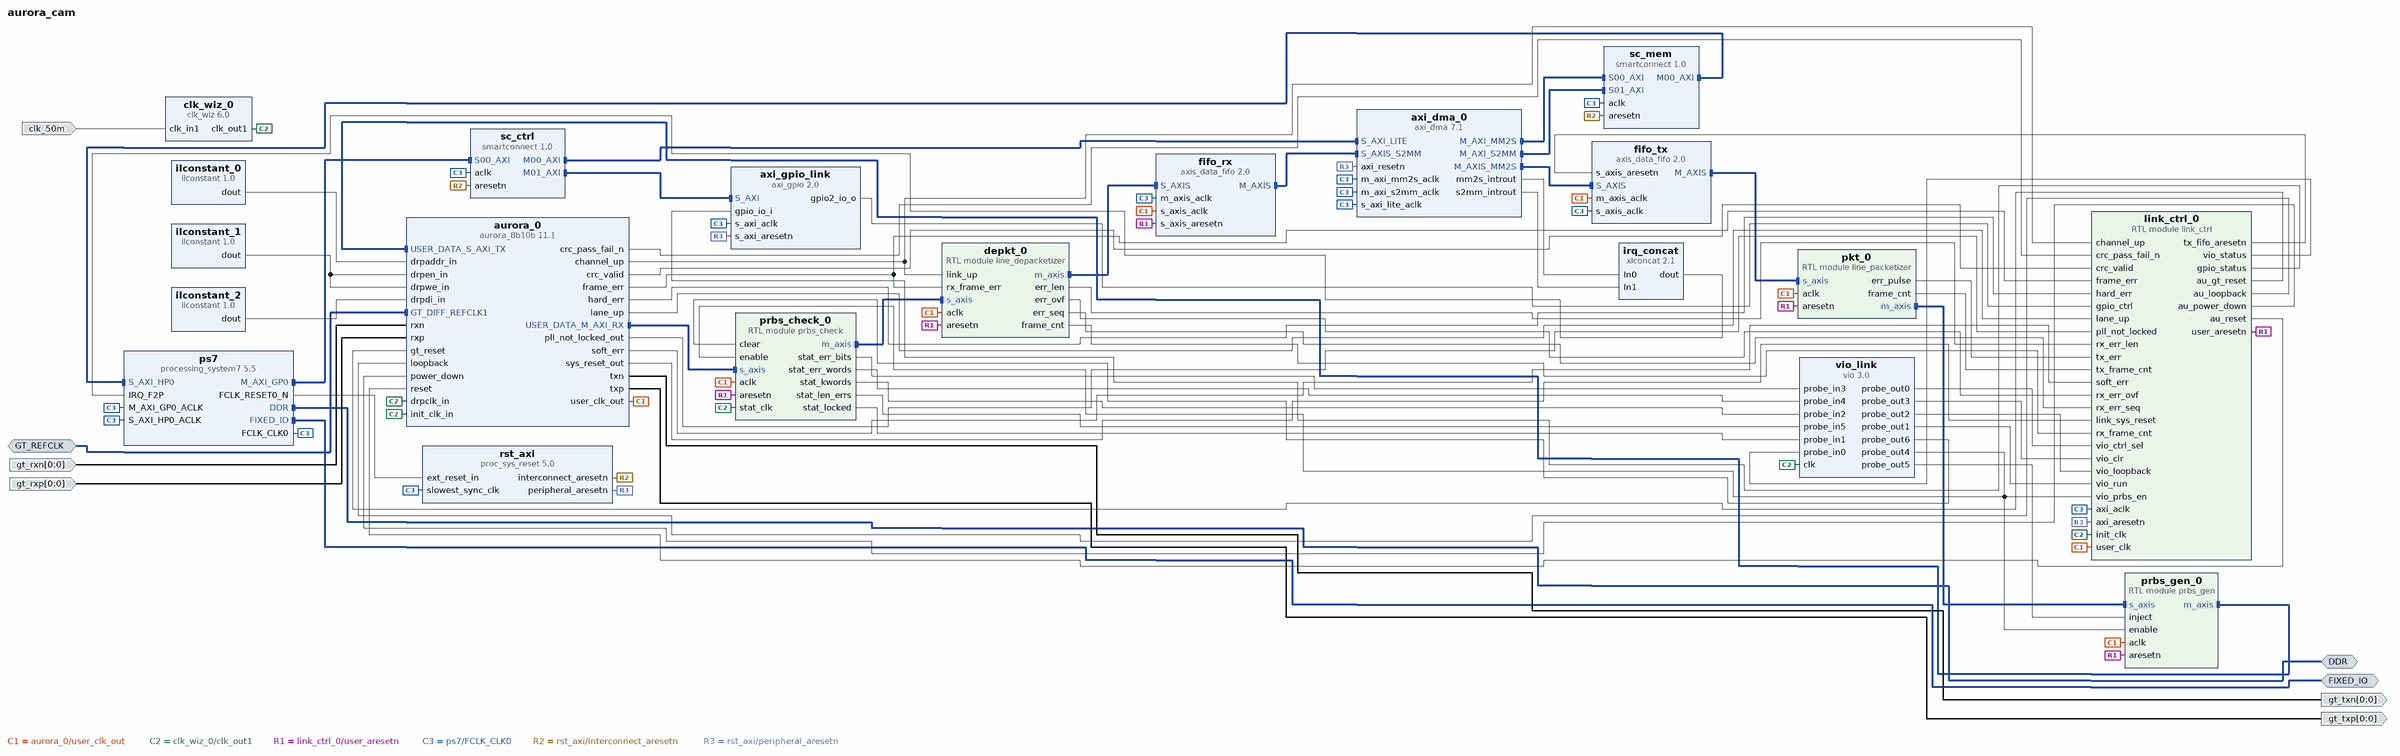
[diagram p0: block diagram of the top level]
# Vivado block design aurora_cam, xc7z015clg485-2, Vivado 2025.2
create_bd_design aurora_cam

create_bd_intf_port -mode Master -vlnv xilinx.com:interface:ddrx_rtl:1.0 DDR
create_bd_intf_port -mode Master -vlnv xilinx.com:display_processing_system7:fixedio_rtl:1.0 FIXED_IO
create_bd_intf_port -mode Slave -vlnv xilinx.com:interface:diff_clock_rtl:1.0 GT_REFCLK
set_property -dict {CONFIG.FREQ_HZ 125000000} [get_bd_intf_ports GT_REFCLK]
create_bd_port -dir O -from 0 -to 0 gt_txp
create_bd_port -dir O -from 0 -to 0 gt_txn
create_bd_port -dir I -from 0 -to 0 gt_rxp
create_bd_port -dir I -from 0 -to 0 gt_rxn
create_bd_port -dir I -type clk clk_50m
set_property -dict {CONFIG.FREQ_HZ 50000000} [get_bd_ports clk_50m]

create_bd_cell -type ip -vlnv xilinx.com:ip:processing_system7:5.5 ps7
set_property -dict [list \
  CONFIG.PCW_APU_PERIPHERAL_FREQMHZ 766.666666 \
  CONFIG.PCW_CPU_CPU_6X4X_MAX_RANGE 767 \
  CONFIG.PCW_ENET0_ENET0_IO {MIO 16 .. 27} \
  CONFIG.PCW_ENET0_GRP_MDIO_ENABLE 1 \
  CONFIG.PCW_ENET0_GRP_MDIO_IO {MIO 52 .. 53} \
  CONFIG.PCW_ENET0_PERIPHERAL_ENABLE 1 \
  CONFIG.PCW_ENET0_RESET_ENABLE 1 \
  CONFIG.PCW_ENET0_RESET_IO {MIO 7} \
  CONFIG.PCW_ENET_RESET_ENABLE 1 \
  CONFIG.PCW_ENET_RESET_SELECT {Share reset pin} \
  CONFIG.PCW_FPGA0_PERIPHERAL_FREQMHZ 100 \
  CONFIG.PCW_GPIO_MIO_GPIO_ENABLE 1 \
  CONFIG.PCW_GPIO_MIO_GPIO_IO MIO \
  CONFIG.PCW_I2C_RESET_ENABLE 0 \
  CONFIG.PCW_IRQ_F2P_INTR 1 \
  CONFIG.PCW_PERIPHERAL_BOARD_PRESET None \
  CONFIG.PCW_PRESET_BANK1_VOLTAGE {LVCMOS 1.8V} \
  CONFIG.PCW_QSPI_GRP_SINGLE_SS_ENABLE 1 \
  CONFIG.PCW_QSPI_GRP_SINGLE_SS_IO {MIO 1 .. 6} \
  CONFIG.PCW_QSPI_PERIPHERAL_ENABLE 1 \
  CONFIG.PCW_QSPI_QSPI_IO {MIO 1 .. 6} \
  CONFIG.PCW_SD0_GRP_CD_ENABLE 0 \
  CONFIG.PCW_SD0_GRP_WP_ENABLE 0 \
  CONFIG.PCW_SD0_PERIPHERAL_ENABLE 1 \
  CONFIG.PCW_SD0_SD0_IO {MIO 40 .. 45} \
  CONFIG.PCW_SDIO_PERIPHERAL_FREQMHZ 100 \
  CONFIG.PCW_SINGLE_QSPI_DATA_MODE x4 \
  CONFIG.PCW_UART0_PERIPHERAL_ENABLE 1 \
  CONFIG.PCW_UART0_UART0_IO {MIO 14 .. 15} \
  CONFIG.PCW_UART1_PERIPHERAL_ENABLE 0 \
  CONFIG.PCW_UART_PERIPHERAL_FREQMHZ 100 \
  CONFIG.PCW_UIPARAM_DDR_FREQ_MHZ 533.333333 \
  CONFIG.PCW_UIPARAM_DDR_MEMORY_TYPE {DDR 3 (Low Voltage)} \
  CONFIG.PCW_UIPARAM_DDR_PARTNO Custom \
  CONFIG.PCW_USB0_PERIPHERAL_ENABLE 1 \
  CONFIG.PCW_USB0_RESET_ENABLE 1 \
  CONFIG.PCW_USB0_RESET_IO {MIO 8} \
  CONFIG.PCW_USB0_USB0_IO {MIO 28 .. 39} \
  CONFIG.PCW_USB_RESET_ENABLE 1 \
  CONFIG.PCW_USB_RESET_SELECT {Share reset pin} \
  CONFIG.PCW_USE_FABRIC_INTERRUPT 1 \
  CONFIG.PCW_USE_S_AXI_HP0 1 \
] [get_bd_cells ps7]
# 522 more settings of ps7 are not shown: defaults, MIO pin electricals, DDR timing, and values the tool derives
create_bd_cell -type ip -vlnv xilinx.com:ip:proc_sys_reset:5.0 rst_axi
create_bd_cell -type ip -vlnv xilinx.com:ip:axi_dma:7.1 axi_dma_0
set_property -dict [list \
  CONFIG.c_addr_width 32 \
  CONFIG.c_include_mm2s 1 \
  CONFIG.c_include_s2mm 1 \
  CONFIG.c_include_sg 0 \
  CONFIG.c_m_axi_mm2s_data_width 64 \
  CONFIG.c_m_axi_s2mm_data_width 64 \
  CONFIG.c_m_axis_mm2s_tdata_width 32 \
  CONFIG.c_mm2s_burst_size 64 \
  CONFIG.c_s2mm_burst_size 64 \
  CONFIG.c_s_axis_s2mm_tdata_width 32 \
  CONFIG.c_sg_length_width 24 \
] [get_bd_cells axi_dma_0]
create_bd_cell -type ip -vlnv xilinx.com:ip:axi_gpio:2.0 axi_gpio_link
set_property -dict [list \
  CONFIG.C_ALL_INPUTS 1 \
  CONFIG.C_ALL_OUTPUTS_2 1 \
  CONFIG.C_DOUT_DEFAULT_2 0x00000005 \
  CONFIG.C_GPIO2_WIDTH 32 \
  CONFIG.C_GPIO_WIDTH 32 \
  CONFIG.C_IS_DUAL 1 \
] [get_bd_cells axi_gpio_link]
create_bd_cell -type ip -vlnv xilinx.com:ip:smartconnect:1.0 sc_ctrl
set_property -dict {CONFIG.NUM_MI 2 CONFIG.NUM_SI 1} [get_bd_cells sc_ctrl]
create_bd_cell -type ip -vlnv xilinx.com:ip:smartconnect:1.0 sc_mem
set_property -dict {CONFIG.NUM_MI 1 CONFIG.NUM_SI 2} [get_bd_cells sc_mem]
create_bd_cell -type ip -vlnv xilinx.com:ip:xlconcat:2.1 irq_concat
set_property -dict {CONFIG.NUM_PORTS 2} [get_bd_cells irq_concat]
create_bd_cell -type ip -vlnv xilinx.com:ip:axis_data_fifo:2.0 fifo_tx
set_property -dict {CONFIG.FIFO_DEPTH 1024 CONFIG.IS_ACLK_ASYNC 1} [get_bd_cells fifo_tx]
create_bd_cell -type ip -vlnv xilinx.com:ip:axis_data_fifo:2.0 fifo_rx
set_property -dict {CONFIG.FIFO_DEPTH 4096 CONFIG.IS_ACLK_ASYNC 1} [get_bd_cells fifo_rx]
create_bd_cell -type module -reference line_packetizer pkt_0
set_property -dict {CONFIG.FMT 0 CONFIG.H_BEATS 640 CONFIG.V_LINES 720} [get_bd_cells pkt_0]
create_bd_cell -type module -reference line_depacketizer depkt_0
set_property -dict {CONFIG.H_BEATS 640 CONFIG.TLAST_PER_LINE 0 CONFIG.V_LINES 720} [get_bd_cells depkt_0]
create_bd_cell -type module -reference link_ctrl link_ctrl_0
set_property -dict {CONFIG.EMULATED 0} [get_bd_cells link_ctrl_0]
create_bd_cell -type module -reference prbs_gen prbs_gen_0
set_property -dict {CONFIG.FRAME_WORDS 256} [get_bd_cells prbs_gen_0]
create_bd_cell -type module -reference prbs_check prbs_check_0
set_property -dict {CONFIG.FRAME_WORDS 256} [get_bd_cells prbs_check_0]
create_bd_cell -type ip -vlnv xilinx.com:ip:vio:3.0 vio_link
set_property -dict [list \
  CONFIG.C_EN_PROBE_IN_ACTIVITY 0 \
  CONFIG.C_NUM_PROBE_IN 6 \
  CONFIG.C_NUM_PROBE_OUT 7 \
  CONFIG.C_PROBE_IN0_WIDTH 32 \
  CONFIG.C_PROBE_IN1_WIDTH 1 \
  CONFIG.C_PROBE_IN2_WIDTH 32 \
  CONFIG.C_PROBE_IN3_WIDTH 32 \
  CONFIG.C_PROBE_IN4_WIDTH 32 \
  CONFIG.C_PROBE_IN5_WIDTH 16 \
  CONFIG.C_PROBE_OUT0_INIT_VAL 0x1 \
  CONFIG.C_PROBE_OUT0_WIDTH 1 \
  CONFIG.C_PROBE_OUT1_INIT_VAL 0x1 \
  CONFIG.C_PROBE_OUT1_WIDTH 1 \
  CONFIG.C_PROBE_OUT2_INIT_VAL 0x2 \
  CONFIG.C_PROBE_OUT2_WIDTH 3 \
  CONFIG.C_PROBE_OUT3_INIT_VAL 0x0 \
  CONFIG.C_PROBE_OUT3_WIDTH 1 \
  CONFIG.C_PROBE_OUT4_INIT_VAL 0x0 \
  CONFIG.C_PROBE_OUT4_WIDTH 1 \
  CONFIG.C_PROBE_OUT5_INIT_VAL 0x0 \
  CONFIG.C_PROBE_OUT5_WIDTH 1 \
  CONFIG.C_PROBE_OUT6_INIT_VAL 0x0 \
  CONFIG.C_PROBE_OUT6_WIDTH 1 \
] [get_bd_cells vio_link]
create_bd_cell -type ip -vlnv xilinx.com:ip:aurora_8b10b:11.1 aurora_0
set_property -dict [list \
  CONFIG.C_AURORA_LANES 1 \
  CONFIG.C_DRP_IF true \
  CONFIG.C_GT_CLOCK_1 GTPQ0 \
  CONFIG.C_GT_LOC_1 X \
  CONFIG.C_GT_LOC_2 1 \
  CONFIG.C_GT_LOC_3 X \
  CONFIG.C_GT_LOC_4 X \
  CONFIG.C_LANE_WIDTH 4 \
  CONFIG.C_LINE_RATE 3.125 \
  CONFIG.C_REFCLK_FREQUENCY 125.000 \
  CONFIG.C_USE_BYTESWAP true \
  CONFIG.C_USE_CRC true \
  CONFIG.C_USE_SCRAMBLER false \
  CONFIG.DRP_FREQ 62.5 \
  CONFIG.Dataflow_Config Duplex \
  CONFIG.Flow_Mode None \
  CONFIG.Interface_Mode Framing \
  CONFIG.SINGLEEND_GTREFCLK false \
  CONFIG.SINGLEEND_INITCLK true \
  CONFIG.SupportLevel 1 \
  CONFIG.TransceiverControl false \
] [get_bd_cells aurora_0]
create_bd_cell -type inline_hdl -vlnv xilinx.com:inline_hdl:ilconstant:1.0 ilconstant_0
set_property -dict {CONFIG.CONST_VAL 0 CONFIG.CONST_WIDTH 9} [get_bd_cells ilconstant_0]
create_bd_cell -type inline_hdl -vlnv xilinx.com:inline_hdl:ilconstant:1.0 ilconstant_1
set_property -dict {CONFIG.CONST_VAL 0} [get_bd_cells ilconstant_1]
create_bd_cell -type inline_hdl -vlnv xilinx.com:inline_hdl:ilconstant:1.0 ilconstant_2
set_property -dict {CONFIG.CONST_VAL 0 CONFIG.CONST_WIDTH 16} [get_bd_cells ilconstant_2]
create_bd_cell -type ip -vlnv xilinx.com:ip:clk_wiz:6.0 clk_wiz_0
set_property -dict [list \
  CONFIG.CLKOUT1_DRIVES BUFG \
  CONFIG.CLKOUT1_JITTER 181.275 \
  CONFIG.CLKOUT1_REQUESTED_OUT_FREQ 62.5 \
  CONFIG.CLKOUT2_DRIVES BUFG \
  CONFIG.CLKOUT3_DRIVES BUFG \
  CONFIG.CLKOUT4_DRIVES BUFG \
  CONFIG.CLKOUT5_DRIVES BUFG \
  CONFIG.CLKOUT6_DRIVES BUFG \
  CONFIG.CLKOUT7_DRIVES BUFG \
  CONFIG.MMCM_CLKOUT0_DIVIDE_F 16.000 \
  CONFIG.SECONDARY_SOURCE Single_ended_clock_capable_pin \
  CONFIG.USE_LOCKED false \
  CONFIG.USE_PHASE_ALIGNMENT false \
  CONFIG.USE_RESET false \
] [get_bd_cells clk_wiz_0]

# ---- connections ----

connect_bd_intf_net [get_bd_intf_ports GT_REFCLK] [get_bd_intf_pins aurora_0/GT_DIFF_REFCLK1]
connect_bd_intf_net [get_bd_intf_pins aurora_0/USER_DATA_M_AXI_RX] [get_bd_intf_pins prbs_check_0/s_axis]
connect_bd_intf_net [get_bd_intf_pins axi_dma_0/M_AXIS_MM2S] [get_bd_intf_pins fifo_tx/S_AXIS]
connect_bd_intf_net [get_bd_intf_pins axi_dma_0/M_AXI_MM2S] [get_bd_intf_pins sc_mem/S00_AXI]
connect_bd_intf_net [get_bd_intf_pins axi_dma_0/M_AXI_S2MM] [get_bd_intf_pins sc_mem/S01_AXI]
connect_bd_intf_net [get_bd_intf_pins depkt_0/m_axis] [get_bd_intf_pins fifo_rx/S_AXIS]
connect_bd_intf_net [get_bd_intf_pins fifo_rx/M_AXIS] [get_bd_intf_pins axi_dma_0/S_AXIS_S2MM]
connect_bd_intf_net [get_bd_intf_pins fifo_tx/M_AXIS] [get_bd_intf_pins pkt_0/s_axis]
connect_bd_intf_net [get_bd_intf_pins pkt_0/m_axis] [get_bd_intf_pins prbs_gen_0/s_axis]
connect_bd_intf_net [get_bd_intf_pins prbs_check_0/m_axis] [get_bd_intf_pins depkt_0/s_axis]
connect_bd_intf_net [get_bd_intf_pins prbs_gen_0/m_axis] [get_bd_intf_pins aurora_0/USER_DATA_S_AXI_TX]
connect_bd_intf_net [get_bd_intf_ports DDR] [get_bd_intf_pins ps7/DDR]
connect_bd_intf_net [get_bd_intf_ports FIXED_IO] [get_bd_intf_pins ps7/FIXED_IO]
connect_bd_intf_net [get_bd_intf_pins ps7/M_AXI_GP0] [get_bd_intf_pins sc_ctrl/S00_AXI]
connect_bd_intf_net [get_bd_intf_pins sc_ctrl/M00_AXI] [get_bd_intf_pins axi_dma_0/S_AXI_LITE]
connect_bd_intf_net [get_bd_intf_pins sc_ctrl/M01_AXI] [get_bd_intf_pins axi_gpio_link/S_AXI]
connect_bd_intf_net [get_bd_intf_pins sc_mem/M00_AXI] [get_bd_intf_pins ps7/S_AXI_HP0]
connect_bd_net [get_bd_pins aurora_0/channel_up] [get_bd_pins link_ctrl_0/channel_up] [get_bd_pins depkt_0/link_up]
connect_bd_net [get_bd_pins aurora_0/crc_pass_fail_n] [get_bd_pins link_ctrl_0/crc_pass_fail_n]
connect_bd_net [get_bd_pins aurora_0/crc_valid] [get_bd_pins link_ctrl_0/crc_valid]
connect_bd_net [get_bd_pins aurora_0/frame_err] [get_bd_pins link_ctrl_0/frame_err] [get_bd_pins depkt_0/rx_frame_err]
connect_bd_net [get_bd_pins aurora_0/hard_err] [get_bd_pins link_ctrl_0/hard_err]
connect_bd_net [get_bd_pins aurora_0/lane_up] [get_bd_pins link_ctrl_0/lane_up]
connect_bd_net [get_bd_pins aurora_0/pll_not_locked_out] [get_bd_pins link_ctrl_0/pll_not_locked]
connect_bd_net [get_bd_pins aurora_0/soft_err] [get_bd_pins link_ctrl_0/soft_err]
connect_bd_net [get_bd_pins aurora_0/sys_reset_out] [get_bd_pins link_ctrl_0/link_sys_reset]
connect_bd_net [get_bd_pins aurora_0/txn] [get_bd_ports gt_txn]
connect_bd_net [get_bd_pins aurora_0/txp] [get_bd_ports gt_txp]
connect_bd_net [get_bd_pins aurora_0/user_clk_out] \
  [get_bd_pins pkt_0/aclk] [get_bd_pins depkt_0/aclk] [get_bd_pins prbs_gen_0/aclk] [get_bd_pins prbs_check_0/aclk] \
  [get_bd_pins fifo_tx/m_axis_aclk] [get_bd_pins fifo_rx/s_axis_aclk] [get_bd_pins link_ctrl_0/user_clk]
connect_bd_net [get_bd_pins axi_dma_0/mm2s_introut] [get_bd_pins irq_concat/In0]
connect_bd_net [get_bd_pins axi_dma_0/s2mm_introut] [get_bd_pins irq_concat/In1]
connect_bd_net [get_bd_pins axi_gpio_link/gpio2_io_o] [get_bd_pins link_ctrl_0/gpio_ctrl]
connect_bd_net [get_bd_ports clk_50m] [get_bd_pins clk_wiz_0/clk_in1]
connect_bd_net [get_bd_pins clk_wiz_0/clk_out1] \
  [get_bd_pins aurora_0/drpclk_in] [get_bd_pins aurora_0/init_clk_in] [get_bd_pins link_ctrl_0/init_clk] \
  [get_bd_pins vio_link/clk] [get_bd_pins prbs_check_0/stat_clk]
connect_bd_net [get_bd_pins depkt_0/err_len] [get_bd_pins link_ctrl_0/rx_err_len]
connect_bd_net [get_bd_pins depkt_0/err_ovf] [get_bd_pins link_ctrl_0/rx_err_ovf]
connect_bd_net [get_bd_pins depkt_0/err_seq] [get_bd_pins link_ctrl_0/rx_err_seq]
connect_bd_net [get_bd_pins depkt_0/frame_cnt] [get_bd_pins link_ctrl_0/rx_frame_cnt]
connect_bd_net [get_bd_ports gt_rxn] [get_bd_pins aurora_0/rxn]
connect_bd_net [get_bd_ports gt_rxp] [get_bd_pins aurora_0/rxp]
connect_bd_net [get_bd_pins ilconstant_0/dout] [get_bd_pins aurora_0/drpaddr_in]
connect_bd_net [get_bd_pins ilconstant_1/dout] [get_bd_pins aurora_0/drpen_in] [get_bd_pins aurora_0/drpwe_in]
connect_bd_net [get_bd_pins ilconstant_2/dout] [get_bd_pins aurora_0/drpdi_in]
connect_bd_net [get_bd_pins irq_concat/dout] [get_bd_pins ps7/IRQ_F2P]
connect_bd_net [get_bd_pins link_ctrl_0/au_gt_reset] [get_bd_pins aurora_0/gt_reset]
connect_bd_net [get_bd_pins link_ctrl_0/au_loopback] [get_bd_pins aurora_0/loopback]
connect_bd_net [get_bd_pins link_ctrl_0/au_power_down] [get_bd_pins aurora_0/power_down]
connect_bd_net [get_bd_pins link_ctrl_0/au_reset] [get_bd_pins aurora_0/reset]
connect_bd_net [get_bd_pins link_ctrl_0/gpio_status] [get_bd_pins axi_gpio_link/gpio_io_i]
connect_bd_net [get_bd_pins link_ctrl_0/tx_fifo_aresetn] [get_bd_pins fifo_tx/s_axis_aresetn]
connect_bd_net [get_bd_pins link_ctrl_0/user_aresetn] \
  [get_bd_pins pkt_0/aresetn] [get_bd_pins depkt_0/aresetn] [get_bd_pins prbs_gen_0/aresetn] \
  [get_bd_pins prbs_check_0/aresetn] [get_bd_pins fifo_rx/s_axis_aresetn]
connect_bd_net -net link_status [get_bd_pins link_ctrl_0/vio_status] [get_bd_pins vio_link/probe_in0]
connect_bd_net [get_bd_pins pkt_0/err_pulse] [get_bd_pins link_ctrl_0/tx_err]
connect_bd_net [get_bd_pins pkt_0/frame_cnt] [get_bd_pins link_ctrl_0/tx_frame_cnt]
connect_bd_net -net prbs_err_bits [get_bd_pins prbs_check_0/stat_err_bits] [get_bd_pins vio_link/probe_in3]
connect_bd_net -net prbs_err_words [get_bd_pins prbs_check_0/stat_err_words] [get_bd_pins vio_link/probe_in4]
connect_bd_net -net prbs_kwords [get_bd_pins prbs_check_0/stat_kwords] [get_bd_pins vio_link/probe_in2]
connect_bd_net -net prbs_len_errs [get_bd_pins prbs_check_0/stat_len_errs] [get_bd_pins vio_link/probe_in5]
connect_bd_net -net prbs_locked [get_bd_pins prbs_check_0/stat_locked] [get_bd_pins vio_link/probe_in1]
connect_bd_net [get_bd_pins ps7/FCLK_CLK0] \
  [get_bd_pins ps7/M_AXI_GP0_ACLK] [get_bd_pins ps7/S_AXI_HP0_ACLK] [get_bd_pins rst_axi/slowest_sync_clk] \
  [get_bd_pins axi_dma_0/m_axi_mm2s_aclk] [get_bd_pins axi_dma_0/m_axi_s2mm_aclk] [get_bd_pins axi_dma_0/s_axi_lite_aclk] \
  [get_bd_pins axi_gpio_link/s_axi_aclk] [get_bd_pins sc_ctrl/aclk] [get_bd_pins sc_mem/aclk] \
  [get_bd_pins fifo_tx/s_axis_aclk] [get_bd_pins fifo_rx/m_axis_aclk] [get_bd_pins link_ctrl_0/axi_aclk]
connect_bd_net [get_bd_pins ps7/FCLK_RESET0_N] [get_bd_pins rst_axi/ext_reset_in]
connect_bd_net [get_bd_pins rst_axi/interconnect_aresetn] [get_bd_pins sc_ctrl/aresetn] [get_bd_pins sc_mem/aresetn]
connect_bd_net [get_bd_pins rst_axi/peripheral_aresetn] \
  [get_bd_pins axi_dma_0/axi_resetn] [get_bd_pins axi_gpio_link/s_axi_aresetn] [get_bd_pins link_ctrl_0/axi_aresetn]
connect_bd_net -net vio_ctrl_sel [get_bd_pins vio_link/probe_out0] [get_bd_pins link_ctrl_0/vio_ctrl_sel]
connect_bd_net -net vio_err_clear [get_bd_pins vio_link/probe_out3] [get_bd_pins link_ctrl_0/vio_clr]
connect_bd_net -net vio_loopback [get_bd_pins vio_link/probe_out2] [get_bd_pins link_ctrl_0/vio_loopback]
connect_bd_net -net vio_prbs_clear [get_bd_pins vio_link/probe_out6] [get_bd_pins prbs_check_0/clear]
connect_bd_net -net vio_prbs_en [get_bd_pins vio_link/probe_out4] \
  [get_bd_pins prbs_gen_0/enable] [get_bd_pins prbs_check_0/enable] [get_bd_pins link_ctrl_0/vio_prbs_en]
connect_bd_net -net vio_prbs_inject [get_bd_pins vio_link/probe_out5] [get_bd_pins prbs_gen_0/inject]
connect_bd_net -net vio_run [get_bd_pins vio_link/probe_out1] [get_bd_pins link_ctrl_0/vio_run]

# ---- address map ----
assign_bd_address -offset 0x00000000 -range 1G -target_address_space [get_bd_addr_spaces axi_dma_0/Data_MM2S] [get_bd_addr_segs ps7/S_AXI_HP0/HP0_DDR_LOWOCM]
assign_bd_address -offset 0x00000000 -range 1G -target_address_space [get_bd_addr_spaces axi_dma_0/Data_S2MM] [get_bd_addr_segs ps7/S_AXI_HP0/HP0_DDR_LOWOCM]
assign_bd_address -offset 0x40400000 -range 64K -target_address_space [get_bd_addr_spaces ps7/Data] [get_bd_addr_segs axi_dma_0/S_AXI_LITE/Reg]
assign_bd_address -offset 0x41200000 -range 64K -target_address_space [get_bd_addr_spaces ps7/Data] [get_bd_addr_segs axi_gpio_link/S_AXI/Reg]

validate_bd_design
save_bd_design
